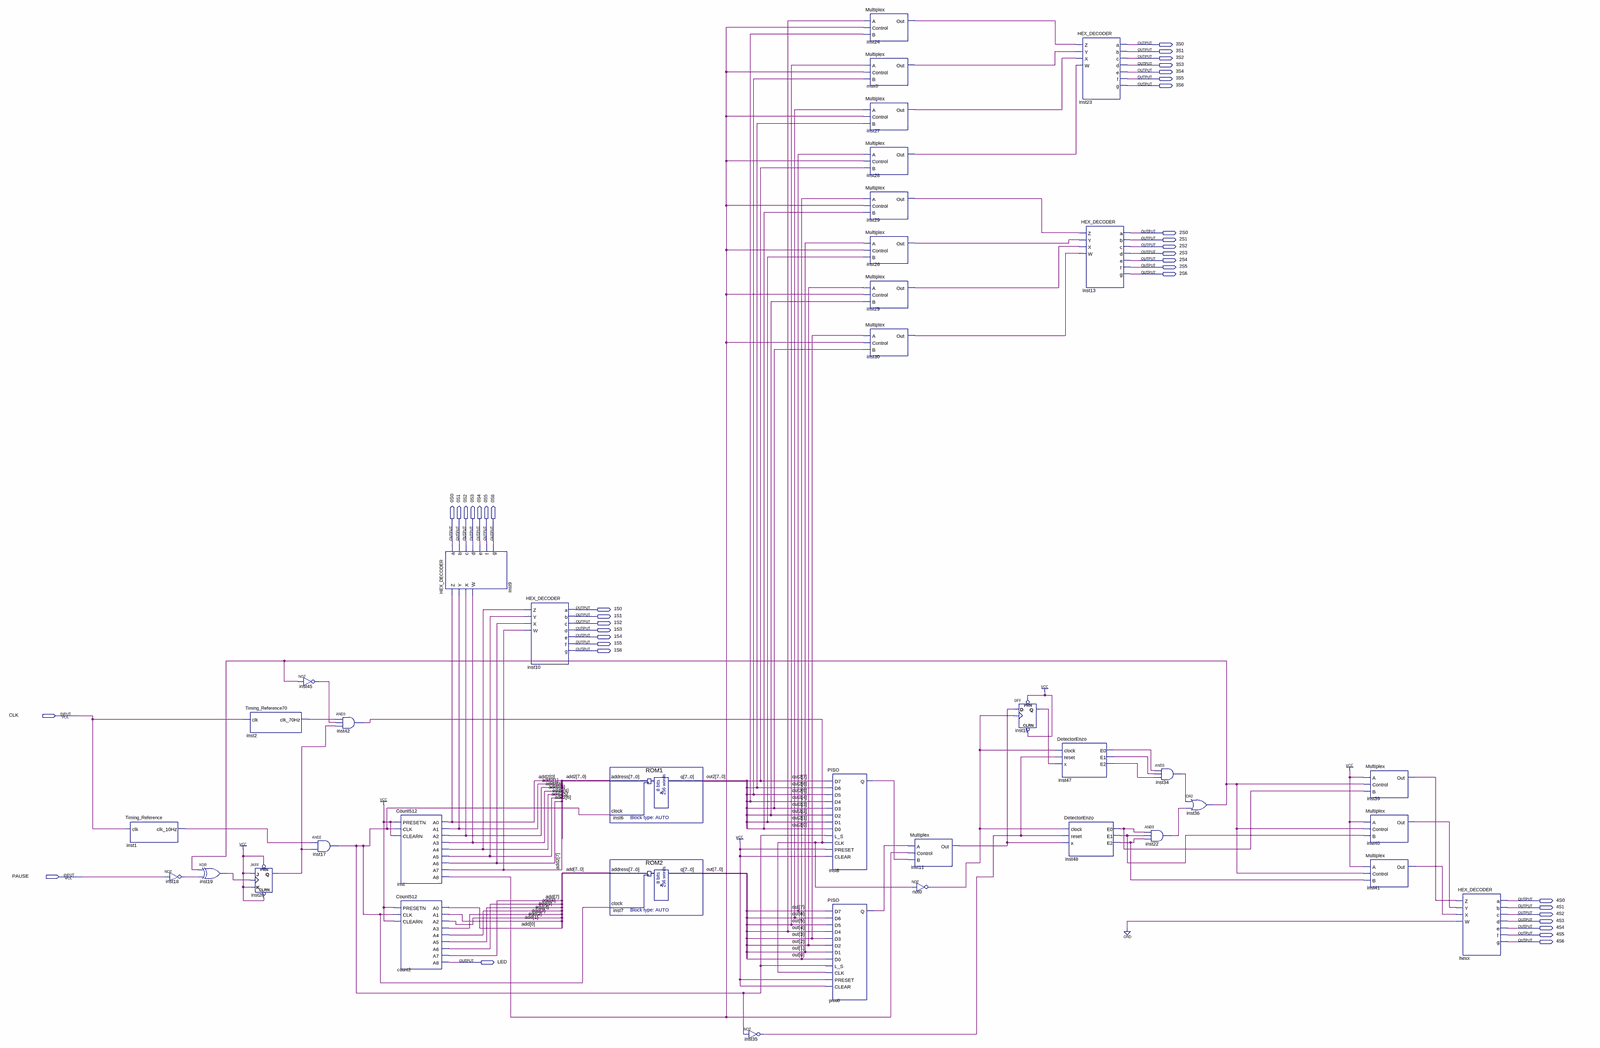
[diagram p0: schematic sheet, whole]
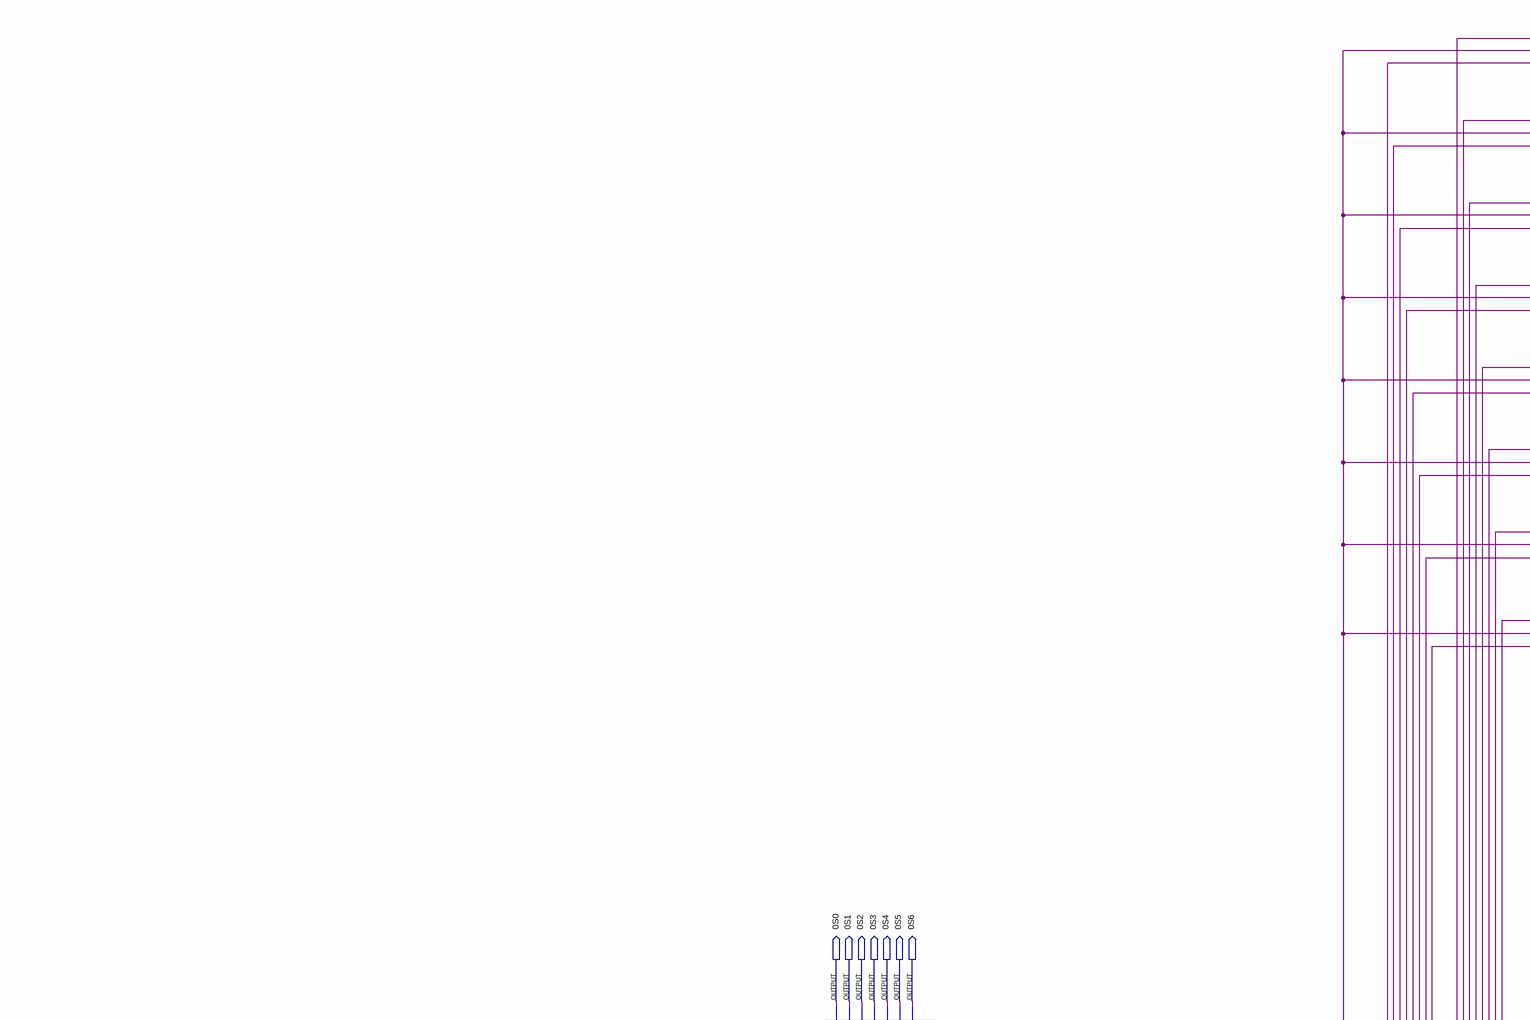
[diagram p1: schematic sheet, upper left part]
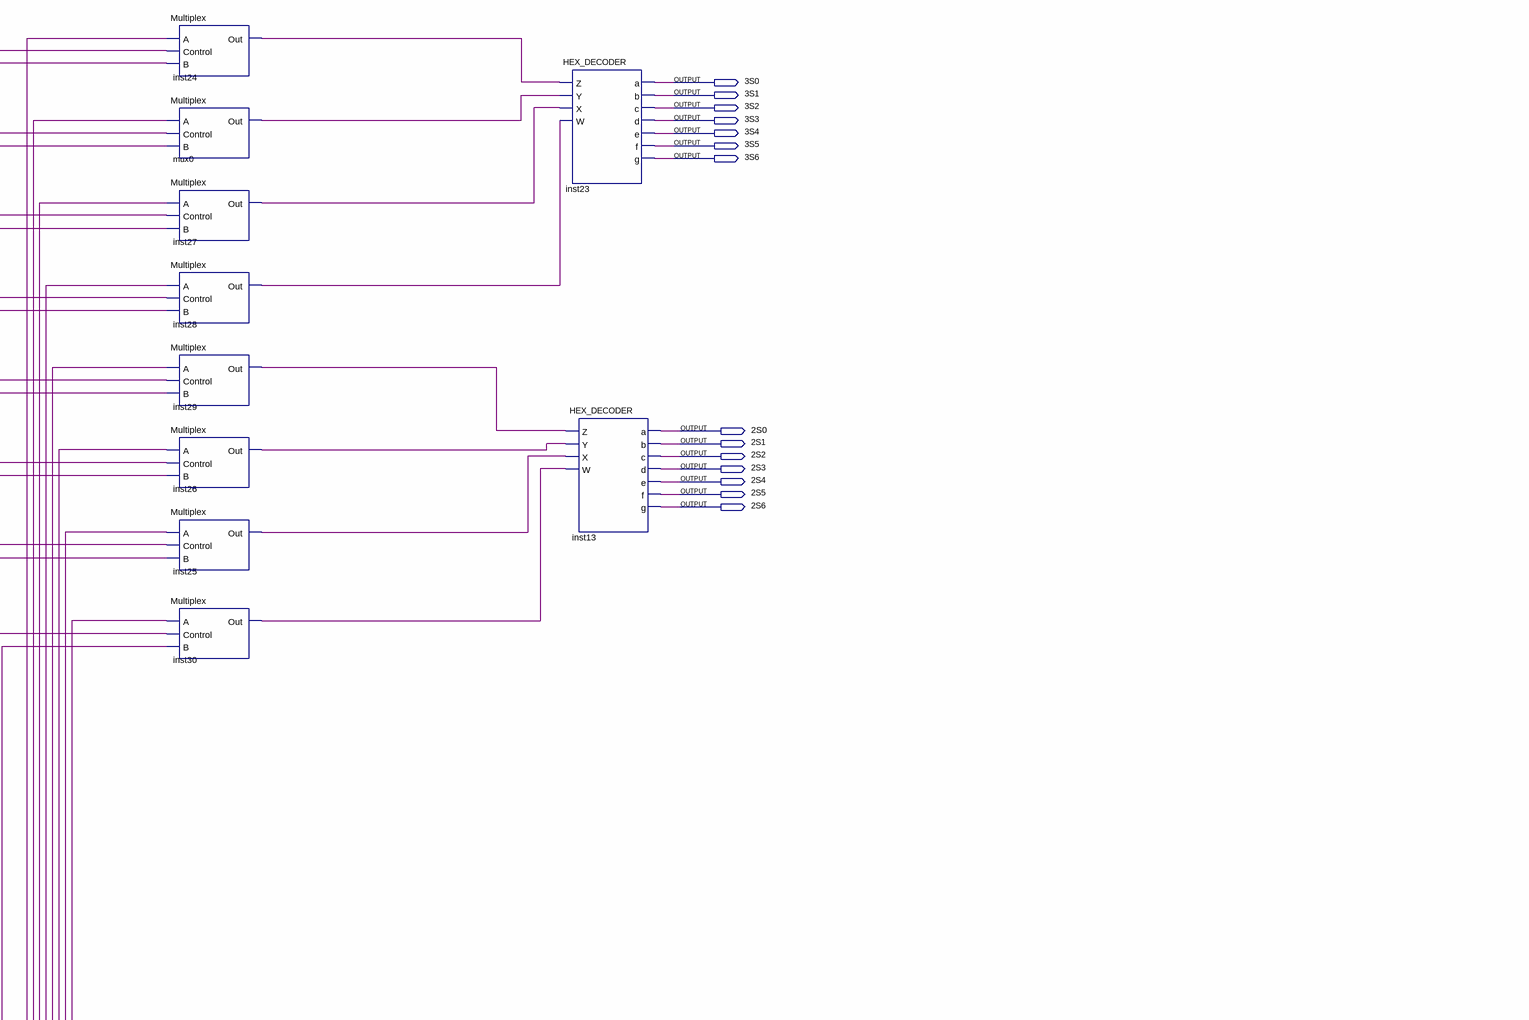
[diagram p2: schematic sheet, upper right part]
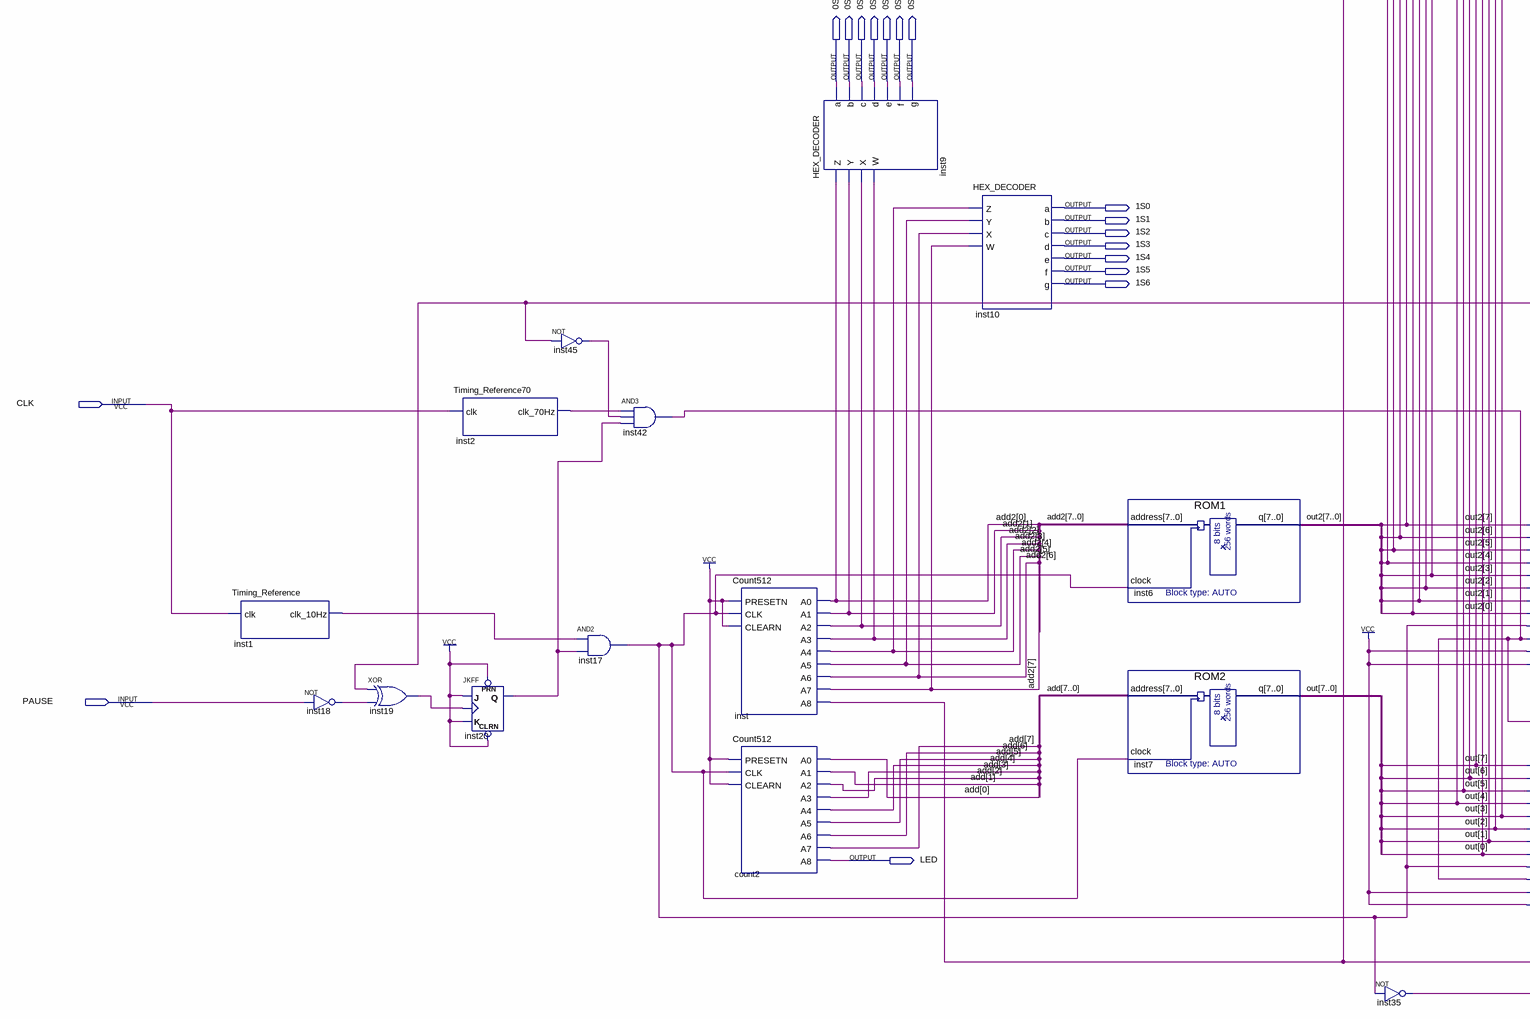
[diagram p3: schematic sheet, lower left part]
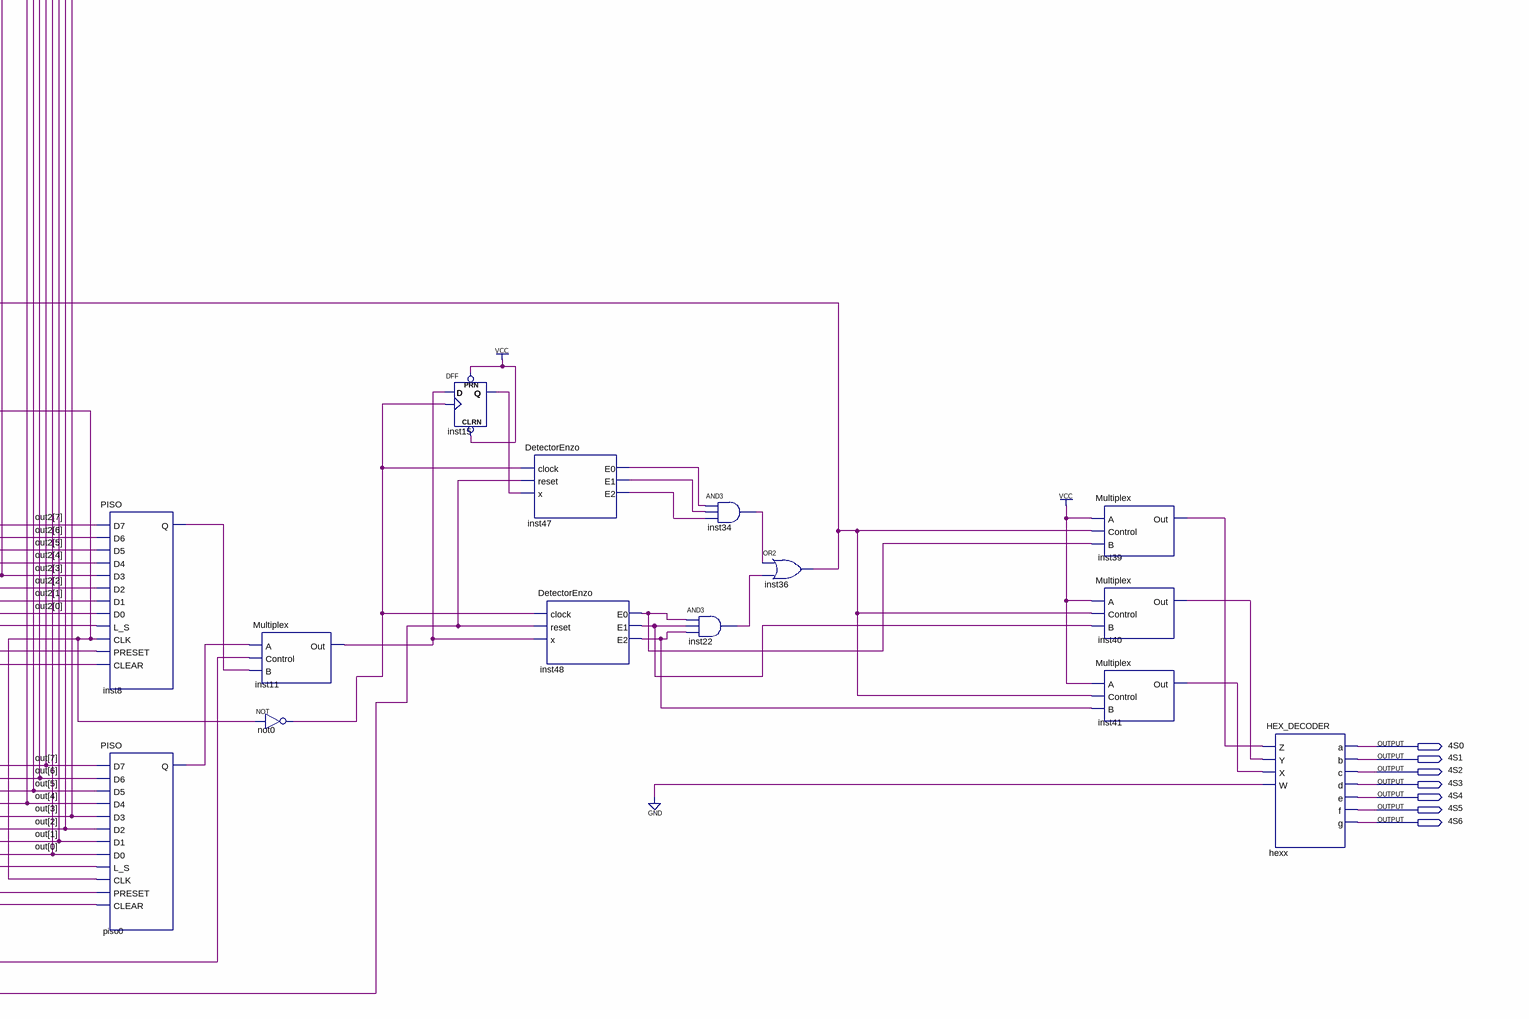
[diagram p4: schematic sheet, lower right part]
// Quartus schematic Memorias.bdf as structural Verilog: 39 symbols, 38 pins
module Memorias (
  input  CLK,
  input  PAUSE,
  output \3S0 ,
  output \3S1 ,
  output \3S2 ,
  output \3S3 ,
  output \3S4 ,
  output \3S5 ,
  output \3S6 ,
  output \2S0 ,
  output \2S1 ,
  output \2S2 ,
  output \2S3 ,
  output \2S4 ,
  output \2S5 ,
  output \2S6 ,
  output \0S0 ,
  output \0S1 ,
  output \0S2 ,
  output \0S3 ,
  output \0S4 ,
  output \0S5 ,
  output \0S6 ,
  output \1S0 ,
  output \1S1 ,
  output \1S2 ,
  output \1S3 ,
  output \1S4 ,
  output \1S5 ,
  output \1S6 ,
  output \4S0 ,
  output \4S1 ,
  output \4S2 ,
  output \4S3 ,
  output \4S4 ,
  output \4S5 ,
  output \4S6 ,
  output LED
);

  wire inst1_clk_10hz, inst2_clk_70hz, inst8_q, inst11_out, inst15_q, inst17_out, inst18_out, inst19_out,
       inst20_q, inst22_out, inst24_out, inst25_out, inst26_out, inst27_out, inst28_out, inst29_out,
       inst30_out, inst34_out, inst35_out, inst36_out, inst39_out, inst40_out, inst41_out, inst42_out,
       inst45_out, inst47_e0, inst47_e1, inst47_e2, inst48_e0, inst48_e1, inst48_e2, inst_a8, mux0_out,
       not0_out, piso0_q;
  wire [7:0] add, add2, out, out2;

  Timing_Reference inst1 (.clk(CLK), .clk_10Hz(inst1_clk_10hz));
  not inst18 (inst18_out, PAUSE);
  xor inst19 (inst19_out, inst36_out, inst18_out);
  Timing_Reference70 inst2 (.clk(CLK), .clk_70Hz(inst2_clk_70hz));
  JKFF inst20 (.PRN(1'b1), .CLRN(1'b1), .K(1'b1), .J(1'b1), .CLK(inst19_out), .Q(inst20_q));
  not inst45 (inst45_out, inst36_out);
  and inst17 (inst17_out, inst1_clk_10hz, inst20_q);
  and inst42 (inst42_out, inst2_clk_70hz, inst45_out, inst20_q);
  Count512 inst (
    .PRESETN(1'b1), .CLK(inst17_out), .CLEARN(1'b1), .A0(add2[0]), .A1(add2[1]), .A2(add2[2]), .A3(add2[3]),
    .A4(add2[4]), .A5(add2[5]), .A6(add2[6]), .A7(add2[7]), .A8(inst_a8));
  Count512 count2 (
    .PRESETN(1'b1), .CLK(inst17_out), .CLEARN(1'b1), .A0(add[0]), .A1(add[1]), .A2(add[2]), .A3(add[3]),
    .A4(add[4]), .A5(add[5]), .A6(add[6]), .A7(add[7]), .A8(LED));
  HEX_DECODER inst9 (
    .Z(add2[0]), .Y(add2[1]), .X(add2[2]), .W(add2[3]), .a(\0S0 ), .b(\0S1 ), .c(\0S2 ), .d(\0S3 ),
    .e(\0S4 ), .f(\0S5 ), .g(\0S6 ));
  HEX_DECODER inst10 (
    .Z(add2[4]), .Y(add2[5]), .X(add2[6]), .W(add2[7]), .a(\1S0 ), .b(\1S1 ), .c(\1S2 ), .d(\1S3 ),
    .e(\1S4 ), .f(\1S5 ), .g(\1S6 ));
  ROM1 inst6 (.address(add2), .clock(inst17_out), .q(out2));
  ROM2 inst7 (.address(add), .clock(inst17_out), .q(out));
  not inst35 (inst35_out, inst17_out);
  PISO inst8 (
    .D7(out2[7]), .D6(out2[6]), .D5(out2[5]), .D4(out2[4]), .D3(out2[3]), .D2(out2[2]), .D1(out2[1]),
    .D0(out2[0]), .L_S(inst17_out), .CLK(inst42_out), .PRESET(1'b1), .CLEAR(1'b1), .Q(inst8_q));
  PISO piso0 (
    .D7(out[7]), .D6(out[6]), .D5(out[5]), .D4(out[4]), .D3(out[3]), .D2(out[2]), .D1(out[1]), .D0(out[0]),
    .L_S(inst17_out), .CLK(inst42_out), .PRESET(1'b1), .CLEAR(1'b1), .Q(piso0_q));
  Multiplex inst24 (.A(out[4]), .Control(inst_a8), .B(out2[4]), .Out(inst24_out));
  Multiplex mux0 (.A(out[5]), .Control(inst_a8), .B(out2[5]), .Out(mux0_out));
  Multiplex inst27 (.A(out[6]), .Control(inst_a8), .B(out2[6]), .Out(inst27_out));
  Multiplex inst28 (.A(out[7]), .Control(inst_a8), .B(out2[7]), .Out(inst28_out));
  Multiplex inst29 (.A(out[0]), .Control(inst_a8), .B(out2[0]), .Out(inst29_out));
  Multiplex inst26 (.A(out[1]), .Control(inst_a8), .B(out2[1]), .Out(inst26_out));
  Multiplex inst25 (.A(out[2]), .Control(inst_a8), .B(out2[2]), .Out(inst25_out));
  Multiplex inst30 (.A(out[3]), .Control(inst_a8), .B(out2[3]), .Out(inst30_out));
  Multiplex inst11 (.A(piso0_q), .Control(inst_a8), .B(inst8_q), .Out(inst11_out));
  not not0 (not0_out, inst42_out);
  DFF inst15 (.CLRN(1'b1), .CLK(not0_out), .D(inst11_out), .PRN(1'b1), .Q(inst15_q));
  DetectorEnzo inst47 (
    .clock(not0_out), .reset(inst35_out), .x(inst15_q), .E0(inst47_e0), .E1(inst47_e1), .E2(inst47_e2));
  DetectorEnzo inst48 (
    .clock(not0_out), .reset(inst35_out), .x(inst11_out), .E0(inst48_e0), .E1(inst48_e1), .E2(inst48_e2));
  HEX_DECODER inst23 (
    .Z(inst24_out), .Y(mux0_out), .X(inst27_out), .W(inst28_out), .a(\3S0 ), .b(\3S1 ), .c(\3S2 ), .d(\3S3 ),
    .e(\3S4 ), .f(\3S5 ), .g(\3S6 ));
  HEX_DECODER inst13 (
    .Z(inst29_out), .Y(inst26_out), .X(inst25_out), .W(inst30_out), .a(\2S0 ), .b(\2S1 ), .c(\2S2 ),
    .d(\2S3 ), .e(\2S4 ), .f(\2S5 ), .g(\2S6 ));
  and inst22 (inst22_out, inst48_e0, inst48_e1, inst48_e2);
  and inst34 (inst34_out, inst47_e0, inst47_e1, inst47_e2);
  or inst36 (inst36_out, inst34_out, inst22_out);
  Multiplex inst39 (.A(1'b1), .Control(inst36_out), .B(inst48_e0), .Out(inst39_out));
  Multiplex inst40 (.A(1'b1), .Control(inst36_out), .B(inst48_e1), .Out(inst40_out));
  Multiplex inst41 (.A(1'b1), .Control(inst36_out), .B(inst48_e2), .Out(inst41_out));
  HEX_DECODER hexx (
    .Z(inst39_out), .Y(inst40_out), .X(inst41_out), .W(1'b0), .a(\4S0 ), .b(\4S1 ), .c(\4S2 ), .d(\4S3 ),
    .e(\4S4 ), .f(\4S5 ), .g(\4S6 ));
endmodule
